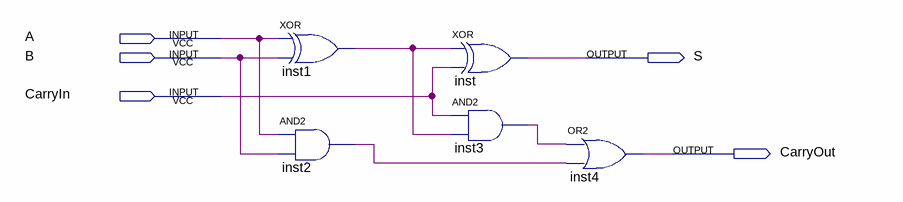
[diagram p0: schematic sheet]
// Quartus schematic fulladder1bit.bdf as structural Verilog: 5 symbols, 5 pins
module fulladder1bit (
  input  A,
  input  B,
  input  CarryIn,
  output S,
  output CarryOut
);

  wire inst1_out, inst2_out, inst3_out;

  xor inst1 (inst1_out, A, B);
  and inst2 (inst2_out, A, B);
  xor inst (S, inst1_out, CarryIn);
  and inst3 (inst3_out, CarryIn, inst1_out);
  or inst4 (CarryOut, inst3_out, inst2_out);
endmodule
